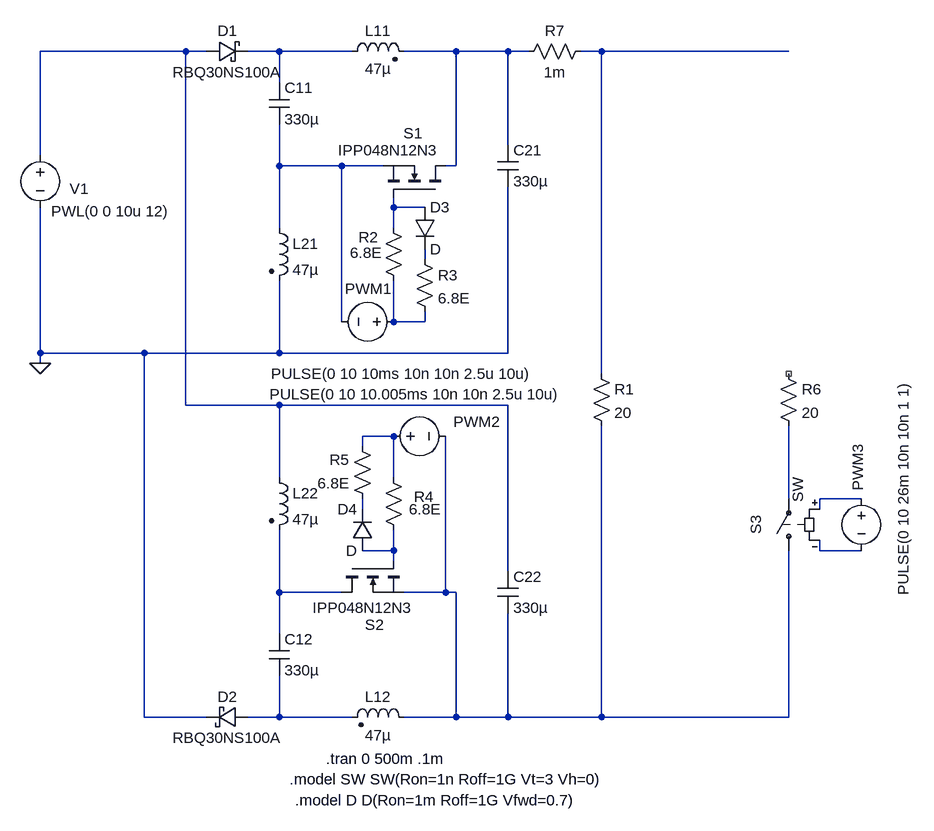
[diagram p0: schematic BC_Type3_components.asc]
BC_Type3_components.asc, the LTspice schematic file:
Version 4
SHEET 1 1276 1264
WIRE 112 96 -112 96
WIRE 144 96 112 96
WIRE 256 96 208 96
WIRE 368 96 256 96
WIRE 528 96 448 96
WIRE 608 96 528 96
WIRE 640 96 608 96
WIRE 752 96 720 96
WIRE 1040 96 752 96
WIRE 256 144 256 96
WIRE 608 240 608 96
WIRE -112 256 -112 96
WIRE 256 272 256 208
WIRE 352 272 256 272
WIRE 416 272 352 272
WIRE 528 272 528 96
WIRE 528 272 512 272
WIRE 432 336 432 320
WIRE 480 336 432 336
WIRE 256 368 256 272
WIRE 432 368 432 336
WIRE 480 416 480 400
WIRE 352 512 352 272
WIRE 432 512 432 448
WIRE 480 512 480 496
WIRE 480 512 432 512
WIRE -112 560 -112 336
WIRE 48 560 -112 560
WIRE 256 560 256 448
WIRE 256 560 48 560
WIRE 608 560 608 304
WIRE 608 560 256 560
WIRE -112 576 -112 560
WIRE 752 592 752 96
WIRE 112 640 112 96
WIRE 256 640 112 640
WIRE 608 640 256 640
WIRE 432 688 384 688
WIRE 384 704 384 688
WIRE 256 752 256 640
WIRE 432 752 432 688
WIRE 1040 784 1040 672
WIRE 1152 784 1088 784
WIRE 384 800 384 784
WIRE 1088 800 1088 784
WIRE 432 864 432 832
WIRE 432 864 384 864
WIRE 1088 864 1088 848
WIRE 1152 864 1088 864
WIRE 432 880 432 864
WIRE 608 896 608 640
WIRE 256 928 256 832
WIRE 352 928 256 928
WIRE 512 928 512 688
WIRE 512 928 448 928
WIRE 528 928 512 928
WIRE 256 992 256 928
WIRE 48 1120 48 560
WIRE 144 1120 48 1120
WIRE 256 1120 256 1056
WIRE 256 1120 208 1120
WIRE 368 1120 256 1120
WIRE 528 1120 528 928
WIRE 528 1120 448 1120
WIRE 608 1120 608 960
WIRE 608 1120 528 1120
WIRE 752 1120 752 672
WIRE 752 1120 608 1120
WIRE 1040 1120 1040 864
WIRE 1040 1120 752 1120
FLAG -112 576 0
SYMBOL cap 240 144 R0
SYMATTR InstName C11
SYMATTR Value 330µ
SYMATTR SpiceLine Rser=0.09
SYMBOL ind2 240 352 R0
SYMATTR InstName L21
SYMATTR Value 47µ
SYMATTR Type ind
SYMATTR SpiceLine Rser=3m
SYMBOL ind2 352 112 R270
WINDOW 0 32 56 VTop 2
WINDOW 3 5 56 VBottom 2
SYMATTR InstName L11
SYMATTR Value 47µ
SYMATTR Type ind
SYMATTR SpiceLine Rser=3m
SYMBOL cap 592 240 R0
SYMATTR InstName C21
SYMATTR Value 330µ
SYMATTR SpiceLine Rser=0.09
SYMBOL cap 240 992 R0
SYMATTR InstName C12
SYMATTR Value 330µ
SYMATTR SpiceLine Rser=0.09
SYMBOL ind2 240 736 R0
SYMATTR InstName L22
SYMATTR Value 47µ
SYMATTR Type ind
SYMATTR SpiceLine Rser=3m
SYMBOL ind2 464 1136 M270
WINDOW 0 32 56 VTop 2
WINDOW 3 4 56 VBottom 2
SYMATTR InstName L12
SYMATTR Value 47µ
SYMATTR Type ind
SYMATTR SpiceLine Rser=3m
SYMBOL cap 592 896 R0
SYMATTR InstName C22
SYMATTR Value 330µ
SYMATTR SpiceLine Rser=0.09
SYMBOL voltage -112 240 R0
WINDOW 123 0 0 Left 0
WINDOW 39 0 0 Left 0
WINDOW 0 45 67 Left 2
WINDOW 3 17 102 Left 2
SYMATTR InstName V1
SYMATTR Value PWL(0 0 10u 12)
SYMBOL res 736 576 R0
SYMATTR InstName R1
SYMATTR Value 20
SYMBOL voltage 448 512 R90
WINDOW 0 -35 55 VBottom 2
WINDOW 3 64 3 VTop 2
WINDOW 123 0 0 Left 0
WINDOW 39 0 0 Left 0
SYMATTR InstName PWM1
SYMATTR Value PULSE(0 10 10ms 10n 10n 2.5u 10u)
SYMBOL voltage 416 688 R270
WINDOW 0 7 144 VTop 2
WINDOW 3 80 50 VBottom 2
WINDOW 123 0 0 Left 0
WINDOW 39 0 0 Left 0
SYMATTR InstName PWM2
SYMATTR Value PULSE(0 10 10.005ms 10n 10n 2.5u 10u)
SYMBOL nmos 512 320 M270
WINDOW 0 98 65 VLeft 2
WINDOW 3 72 166 VLeft 2
SYMATTR InstName S1
SYMATTR Value IPP048N12N3
SYMBOL nmos 352 880 M90
WINDOW 0 98 65 VLeft 2
WINDOW 3 72 109 VLeft 2
SYMATTR InstName S2
SYMATTR Value IPP048N12N3
SYMBOL res 416 352 R0
WINDOW 0 -38 30 Left 2
WINDOW 3 -51 54 Left 2
SYMATTR InstName R2
SYMATTR Value 6.8E
SYMBOL diode 464 336 R0
SYMATTR InstName D3
SYMBOL res 464 400 R0
SYMATTR InstName R3
SYMATTR Value 6.8E
SYMBOL res 448 848 R180
WINDOW 0 -46 67 Left 2
WINDOW 3 -57 48 Left 2
SYMATTR InstName R4
SYMATTR Value 6.8E
SYMBOL diode 400 864 R180
WINDOW 0 24 64 Left 2
WINDOW 3 24 0 Left 2
SYMATTR InstName D4
SYMBOL res 400 800 R180
WINDOW 0 36 76 Left 2
WINDOW 3 36 40 Left 2
SYMATTR InstName R5
SYMATTR Value 6.8E
SYMBOL sw 1040 880 R180
WINDOW 0 50 41 VRight 2
WINDOW 3 -14 90 VRight 2
SYMATTR InstName S3
SYMBOL voltage 1152 768 R0
WINDOW 0 10 -32 VBottom 2
WINDOW 3 49 0 VTop 2
WINDOW 123 0 0 Left 0
WINDOW 39 0 0 Left 0
SYMATTR InstName PWM3
SYMATTR Value PULSE(0 10 26m 10n 10n 1 1)
SYMBOL res 1024 576 R0
SYMATTR InstName R6
SYMATTR Value 20
SYMBOL res 624 112 R270
WINDOW 0 32 56 VTop 2
WINDOW 3 0 56 VBottom 2
SYMATTR InstName R7
SYMATTR Value 1m
SYMBOL schottky 144 112 R270
WINDOW 0 32 32 VTop 2
WINDOW 3 0 32 VBottom 2
SYMATTR InstName D1
SYMATTR Value RBQ30NS100A
SYMATTR Description Diode
SYMATTR Type diode
SYMBOL schottky 208 1104 R90
WINDOW 0 0 32 VBottom 2
WINDOW 3 32 32 VTop 2
SYMATTR InstName D2
SYMATTR Value RBQ30NS100A
SYMATTR Description Diode
SYMATTR Type diode
TEXT 328 1184 Left 2 !.tran 0 500m .1m
TEXT 280 1248 Left 2 !.model D D(Ron=1m Roff=1G Vfwd=0.7)
TEXT 272 1216 Left 2 !.model SW SW(Ron=1n Roff=1G Vt=3 Vh=0)

The netlist it stands for:
* BC_Type3_components.asc
C11 N002 N005 330µ Rser=0.09
L21 N005 0 47µ Rser=3m
L11 N002 N003 47µ Rser=3m
C21 N003 0 330µ Rser=0.09
C12 N015 N017 330µ Rser=0.09
L22 N001 N015 47µ Rser=3m
L12 N016 N017 47µ Rser=3m
C22 N001 N016 330µ Rser=0.09
V1 N001 0 PWL(0 0 10u 12)
R1 N004 N016 20
V§PWM1 N008 N005 PULSE(0 10 10ms 10n 10n 2.5u 10u)
V§PWM2 N009 N016 PULSE(0 10 10.005ms 10n 10n 2.5u 10u)
M§S1 N003 N006 N005 N005 IPP048N12N3
M§S2 N015 N013 N016 N016 IPP048N12N3
R2 N006 N008 6.8E
D3 N006 N007 D
R3 N007 N008 6.8E
R4 N013 N009 6.8E
D4 N013 N012 D
R5 N012 N009 6.8E
S3 N016 N010 N011 N014 SW
V§PWM3 N011 N014 PULSE(0 10 26m 10n 10n 1 1)
R6 NC_01 N010 20
R7 N003 N004 1m
D1 N001 N002 RBQ30NS100A
D2 N017 0 RBQ30NS100A
.model D D
.lib standard.dio
.model NMOS NMOS
.model PMOS PMOS
.lib standard.mos
.tran 0 500m .1m
.model D D(Ron=1m Roff=1G Vfwd=0.7)
.model SW SW(Ron=1n Roff=1G Vt=3 Vh=0)
.backanno
.end